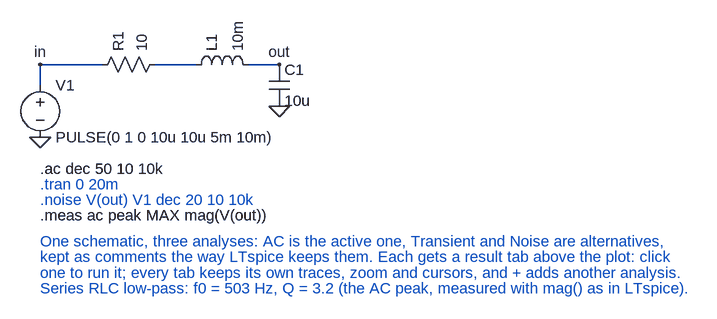
[diagram p0: schematic analysis_tabs.asc]
analysis_tabs.asc, the LTspice schematic file:
Version 4
SHEET 1 880 680
WIRE 0 96 0 64
WIRE 0 64 96 64
WIRE 176 64 240 64
WIRE 320 64 368 64
FLAG 0 64 in
FLAG 368 64 out
FLAG 0 176 0
FLAG 368 128 0
SYMBOL voltage 0 80 R0
SYMATTR InstName V1
SYMATTR Value PULSE(0 1 0 10u 10u 5m 10m)
SYMATTR Value2 AC 1
SYMBOL res 80 80 R270
SYMATTR InstName R1
SYMATTR Value 10
SYMBOL ind 224 80 R270
SYMATTR InstName L1
SYMATTR Value 10m
SYMBOL cap 352 64 R0
SYMATTR InstName C1
SYMATTR Value 10u
TEXT 0 224 Left 2 !.ac dec 50 10 10k
TEXT 0 248 Left 2 ;.tran 0 20m
TEXT 0 272 Left 2 ;.noise V(out) V1 dec 20 10 10k
TEXT 0 296 Left 2 !.meas ac peak MAX mag(V(out))
TEXT 0 336 Left 2 ;One schematic, three analyses: AC is the active one, Transient and Noise are alternatives,
TEXT 0 360 Left 2 ;kept as comments the way LTspice keeps them. Each gets a result tab above the plot: click
TEXT 0 384 Left 2 ;one to run it; every tab keeps its own traces, zoom and cursors, and + adds another analysis.
TEXT 0 408 Left 2 ;Series RLC low-pass: f0 = 503 Hz, Q = 3.2 (the AC peak, measured with mag() as in LTspice).

The netlist it stands for:
* analysis_tabs.asc
V1 in 0 PULSE(0 1 0 10u 10u 5m 10m) AC 1
R1 in N001 10
L1 N001 out 10m
C1 out 0 10u
.ac dec 50 10 10k
* .tran 0 20m
* .noise V(out) V1 dec 20 10 10k
.meas ac peak MAX mag(V(out))
* One schematic, three analyses: AC is the active one, Transient and Noise are alternatives,
* kept as comments the way LTspice keeps them. Each gets a result tab above the plot: click
* one to run it; every tab keeps its own traces, zoom and cursors, and + adds another analysis.
* Series RLC low-pass: f0 = 503 Hz, Q = 3.2 (the AC peak, measured with mag() as in LTspice).
.backanno
.end